# Altium project a4403-ELE-CAD.PrjPcb (part 2 of 4)

## Sheet Hdr3.SchDoc
size Letter; SheetNumber: 10; SheetTotal: 15
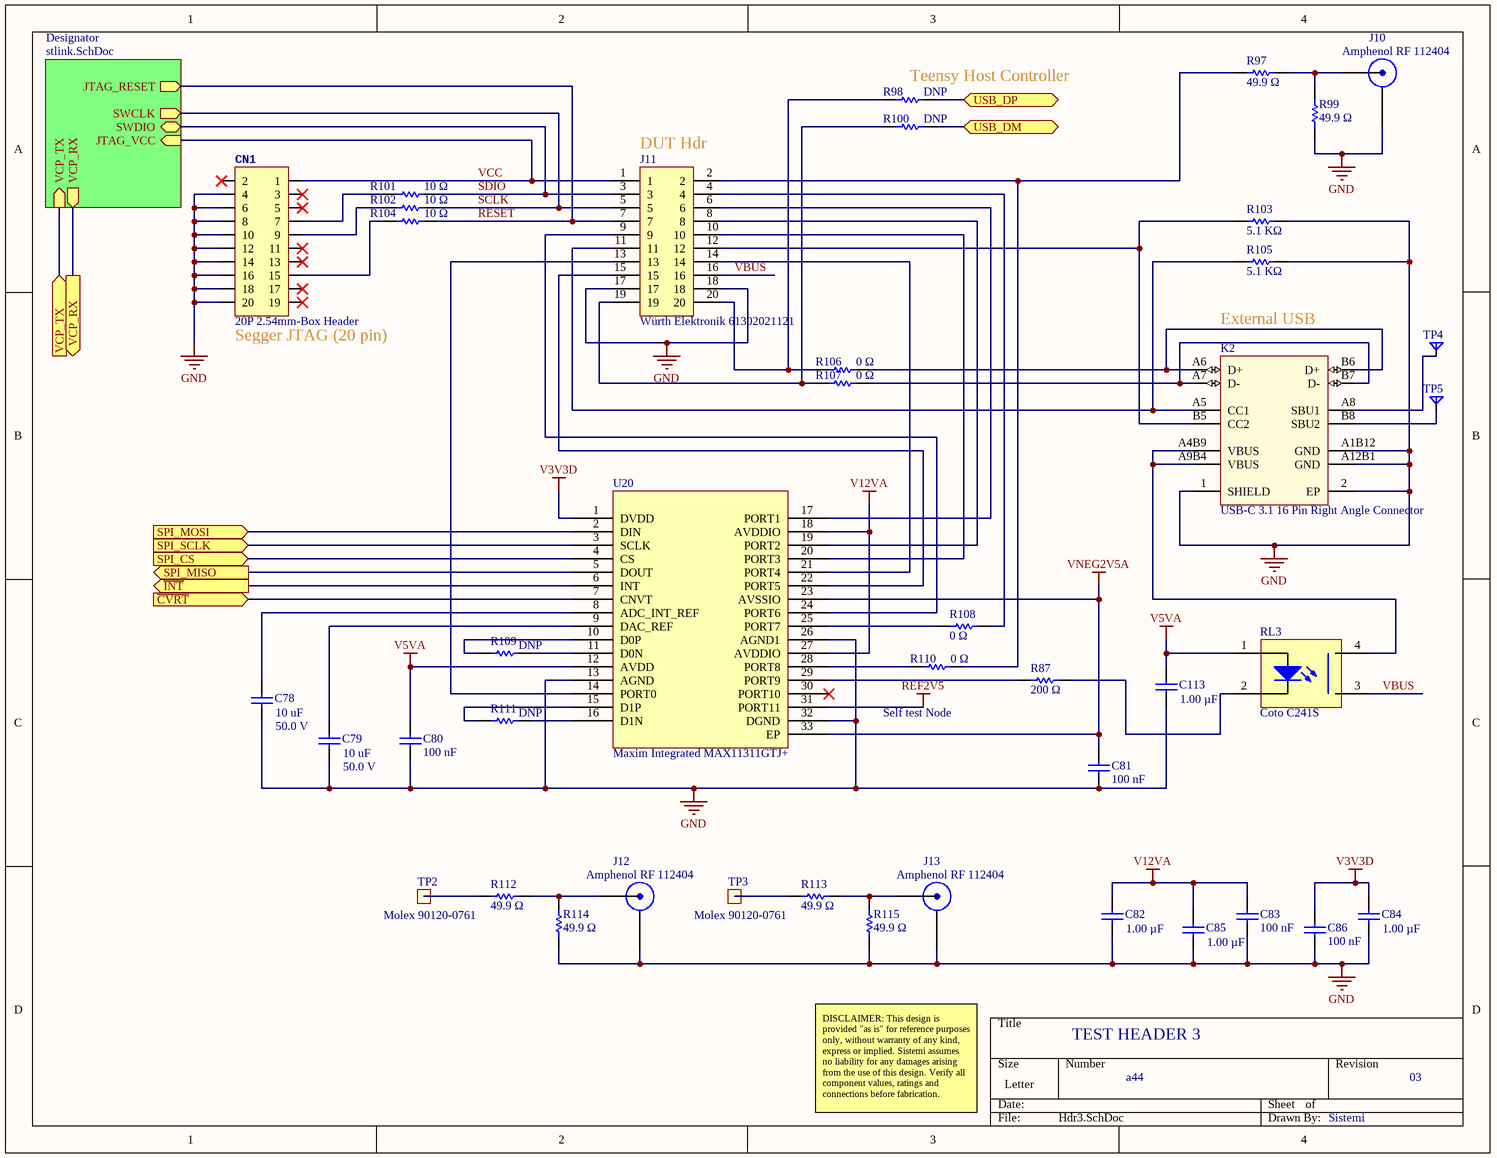
[diagram p5: Hdr3.SchDoc]

### Parts
C78  Capacitance: 10 uF  Voltage Rating (DC): 50.0 V  [CAPC3216X180X55LL20T25]  (hidden comment: Murata GRM31CR61H106KA12L)
C79  Capacitance: 10 uF  Voltage Rating (DC): 50.0 V  [CAPC3216X180X55LL20T25]  (hidden comment: Murata GRM31CR61H106KA12L)
C80  Capacitance: 100 nF  [CAPC1005X56X25NL10T15]  (hidden comment: Samsung CL05B104KO5NNNC)
C81  Capacitance: 100 nF  [CAPC1005X56X25NL10T15]  (hidden comment: Samsung CL05B104KO5NNNC)
C82  Capacitance: 1.00 µF  [CAPC1608X90X35NL15T15]  (hidden comment: Samsung CL10B105KA8NNNC)
C83  Capacitance: 100 nF  [CAPC1005X56X25NL10T15]  (hidden comment: Samsung CL05B104KO5NNNC)
C84  Capacitance: 1.00 µF  [CAPC1608X90X35NL15T15]  (hidden comment: Samsung CL10B105KA8NNNC)
C85  Capacitance: 1.00 µF  [CAPC1608X90X35NL15T15]  (hidden comment: Samsung CL10B105KA8NNNC)
C86  Capacitance: 100 nF  [CAPC1005X56X25NL10T15]  (hidden comment: Samsung CL05B104KO5NNNC)
C113  Capacitance: 1.00 µF  [CAPC1608X90X35NL15T15]  (hidden comment: Samsung CL10B105KA8NNNC)
CN1  20P 2.54mm-Box Header  [PCB-h3ow9p0wpqltbs651onh-1]
J10  Amphenol RF 112404  [PCB-bfdufqe5asedaz2dexug-1]
J11  Würth Elektronik 61302021121  [PCB-nk6cd1c3p7lqby8wsdwb-1]
J12  Amphenol RF 112404  [PCB-bfdufqe5asedaz2dexug-1]
J13  Amphenol RF 112404  [PCB-bfdufqe5asedaz2dexug-1]
K2  USB-C 3.1 16 Pin Right Angle Connector  [PCB-ld6ppm2v3fcnldhcn63r-1]
R87  Resistance: 200 Ω  [RESC1608X55X30LL15T15]  (hidden comment: Generic RES 0603)
R97  Resistance: 49.9 Ω  [RESC1608X55X30ML15T15]  (hidden comment: Generic RES 0603)
R98  Resistance: DNP  [RESC1608X55X30ML15T15]  (hidden comment: Generic RES 0603)
R99  Resistance: 49.9 Ω  [RESC1608X55X30ML15T15]  (hidden comment: Generic RES 0603)
R100  Resistance: DNP  [RESC1608X55X30ML15T15]  (hidden comment: Generic RES 0603)
R101  Resistance: 10 Ω  [RESC1005X40X25NL05T05]  (hidden comment: 10 Ω,±1%,0402)
R102  Resistance: 10 Ω  [RESC1005X40X25NL05T05]  (hidden comment: 10 Ω,±1%,0402)
R103  Resistance: 5.1 KΩ  [RESC1608X55X30ML15T15]  (hidden comment: Generic RES 0603)
R104  Resistance: 10 Ω  [RESC1005X40X25NL05T05]  (hidden comment: 10 Ω,±1%,0402)
R105  Resistance: 5.1 KΩ  [RESC1608X55X30ML15T15]  (hidden comment: Generic RES 0603)
R106  Resistance: 0 Ω  [RESC1608X55X30ML15T15]  (hidden comment: Generic RES 0603)
R107  Resistance: 0 Ω  [RESC1608X55X30ML15T15]  (hidden comment: Generic RES 0603)
R108  Resistance: 0 Ω  [RESC1608X55X30ML15T15]  (hidden comment: Generic RES 0603)
R109  Resistance: DNP  [RESC1608X55X30ML15T15]  (hidden comment: Generic RES 0603)
R110  Resistance: 0 Ω  [RESC1608X55X30ML15T15]  (hidden comment: Generic RES 0603)
R111  Resistance: DNP  [RESC1608X55X30ML15T15]  (hidden comment: Generic RES 0603)
R112  Resistance: 49.9 Ω  [RESC1608X55X30ML15T15]  (hidden comment: Generic RES 0603)
R113  Resistance: 49.9 Ω  [RESC1608X55X30ML15T15]  (hidden comment: Generic RES 0603)
R114  Resistance: 49.9 Ω  [RESC1608X55X30ML15T15]  (hidden comment: Generic RES 0603)
R115  Resistance: 49.9 Ω  [RESC1608X55X30ML15T15]  (hidden comment: Generic RES 0603)
RL3  Coto C241S  [PCB-o1m8470la7x8r6xoffbd-1]
TP2  Molex 90120-0761  [PCB-u1j2a009byds4mriae4x-1]
TP3  Molex 90120-0761  [PCB-u1j2a009byds4mriae4x-1]
TP4  Test Point Pad  [PCB-w5299rxaittb4m04ntfs-1]  (value not drawn)
TP5  Test Point Pad  [PCB-w5299rxaittb4m04ntfs-1]  (value not drawn)
U20  Maxim Integrated MAX11311GTJ+  [PCB-s1hzzxkmij8s4b201del-1]

### Sub-sheets
Designator = stlink.SchDoc: SWCLK (out), JTAG_RESET (out), SWDIO (bidir), JTAG_VCC (in), VCP_TX (in), VCP_RX (out)

### Ports
SPI_CS (in), SPI_MISO (out), SPI_MOSI (in), SPI_SCLK (in), USB_DM (bidir), USB_DP (bidir), VCP_RX (out), VCP_TX (in), ~{CVRT} (in), ~{INT} (out)

### Nets
GND: C78.1 C79.1 C80.2 C81.2 C82.1 C83.2 C84.1 C85.1 C86.2 C113.1 CN1.4 CN1.6 CN1.8 CN1.10 CN1.12 CN1.14 CN1.16 CN1.18 CN1.20 J10.2 J11.17 J11.18 J12.2 J13.2 K2.1(SHIELD) K2.2(EP) K2.A1B12(GND) K2.A12B1(GND) R99.2 R103.1 R105.1 R114.2 R115.2 U20.13(AGND) U20.26(AGND1) U20.32(DGND)
REF2V5: U20.31(PORT11)
V3V3D: C84.2 C86.1 U20.1(DVDD)
V5VA: C80.1 C113.2 RL3.1(A) U20.12(AVDD)
V12VA: C82.2 C83.1 C85.2 U20.18(AVDDIO) U20.27(AVDDIO)
VNEG2V5A: C81.1 U20.23(AVSSIO) U20.33(EP)
ADC_INT: U20.6(INT) ; port ~{INT}
RESET: J11.7 R104.1 ; sheet Designator/JTAG_RESET
SCLK: J11.5 R102.1 ; sheet Designator/SWCLK
SDIO: J11.3 R101.1 ; sheet Designator/SWDIO
SPI_CS_HDR3: U20.4(CS) ; port SPI_CS
SPI_MISO: U20.5(DOUT) ; port SPI_MISO
SPI_MOSI: U20.2(DIN) ; port SPI_MOSI
SPI_SCK: U20.3(SCLK) ; port SPI_SCLK
VBUS: J11.16 RL3.3(S)
VCC: CN1.1 J11.1 ; sheet Designator/JTAG_VCC
NetC78_2: C78.2 U20.8(ADC_INT_REF)
NetC79_2: C79.2 U20.9(DAC_REF)
NetCN1_7: CN1.7 R101.2
NetCN1_9: CN1.9 R102.2
NetCN1_15: CN1.15 R104.2
NetJ10_1: J10.1 R97.2 R99.1
NetJ11_2: J11.2 R97.1 R110.1
NetJ11_4: J11.4 R108.1
NetJ11_6: J11.6 U20.17(PORT1)
NetJ11_8: J11.8 U20.19(PORT2)
NetJ11_9: J11.9 U20.24(PORT6)
NetJ11_10: J11.10 U20.20(PORT3)
NetJ11_11: J11.11 K2.A5(CC1) R105.2
NetJ11_12: J11.12 K2.B5(CC2) R103.2
NetJ11_13: J11.13 U20.14(PORT0)
NetJ11_14: J11.14 U20.21(PORT4)
NetJ11_15: J11.15 U20.22(PORT5)
NetJ11_19: J11.19 R100.2 R107.2
NetJ11_20: J11.20 R98.2 R106.2
NetJ12_1: J12.1 R112.2 R114.1
NetJ13_1: J13.1 R113.2 R115.1
NetK2_A4B9: K2.A4B9(VBUS) K2.A9B4(VBUS) RL3.4(D)
NetK2_A6: K2.A6(D+) K2.B6(D+) R106.1
NetK2_A7: K2.A7(D-) K2.B7(D-) R107.1
NetK2_A8: K2.A8(SBU1) TP4.1(A)
NetK2_B8: K2.B8(SBU2) TP5.1(A)
NetR87_1: R87.1 RL3.2(K)
NetR87_2: R87.2 U20.29(PORT9)
NetR98_1: R98.1 ; port USB_DP
NetR100_1: R100.1 ; port USB_DM
NetR108_2: R108.2 U20.25(PORT7)
NetR109_1: R109.1 U20.11(D0N)
NetR109_2: R109.2 U20.10(D0P)
NetR110_2: R110.2 U20.28(PORT8)
NetR111_1: R111.1 U20.16(D1N)
NetR111_2: R111.2 U20.15(D1P)
NetR112_1: R112.1 TP2.1
NetR113_1: R113.1 TP3.1
NetR135_1: port VCP_TX, sheet Designator/VCP_TX
NetR136_1: port VCP_RX, sheet Designator/VCP_RX
NetU1_9: U20.7(CNVT) ; port ~{CVRT}

Not connected (* = marked no-connect by the designer): CN1 2* 3* 5* 11* 13* 17* 19*; U20 30(PORT10)*

### Notes on the sheet
- (near R98) Teensy Host Controller
- (near J11) DUT Hdr
- (near CN1) Segger JTAG (20 pin)
- External USB
- (near R110) Self test Node
- TEST HEADER 3
- DISCLAIMER: This design is provided "as is" for reference purposes only, without warranty of any kind, express or implied. Sistemi assumes no liability for any damages arising from the use of this design. Verify all component values, ratings and connections before fabrication.
- a44
- 03
- Sistemi

### Library data of the parts
C78 C79 = CMP-3554908-2: as C24 on sheet VBAT; Dielectric Characteristic: X5R; Lifecycle Status: Active; Mounting Style: Surface Mount; Number of Pins: 2; Octopart Url: https://octopart.com/grm31cr61h106ka12l-murata-18903335; OctopartID: fd8535afa9c42242; Packaging: Cut Tape (CT); REACH SVHC Compliance: No SVHC; RoHS: Compliant; Size-Length: 0.0032 m; Size-Thickness: 0.0016 m; Size-Width: 0.0016 m
C80 C81 C83 C86 = CMP-bf2276a55d9a60e5-19: as C25 on sheet VBAT; Mounting Style: Surface Mount; Case/Package: 0402; OctopartID: 0755ced2c795d892; Footprint: PCB-0002-00476-3; Octopart URL: https://octopart.com/cl05b104ko5nnnc-samsung-9299366; RoHS: Compliant; Manufacturer Part Number: CL05B104KO5NNNC
C82 C84 C85 C113 = CMP-7473528-5: as C26 on sheet VBAT; RoHS: Compliant; Mounting Style: Surface Mount; Footprint: PCB-0002-00062-3; Octopart URL: http://octopart.com/cl10b105ka8nnnc-samsung-19831597; Case/Package: 0603; OctopartID: ce7a065e703111bd; Dielectric Characteristic: X7R
CN1 = CMP-2336eab41549fcf1-2: Male Box Header WR-BHD, THT, Vertical, pitch 2.54 mm, 20 pins; Manufacturer Part Number: 61202021621; Number of Contacts: 20; Dielectric Withstanding Voltage: 500 V; Current Rating: 3.00 A; Pin Pitch: 2.54 mm; Contact Resistance: 20.0 mΩ; Operating Voltage: 250 V; Insulation Resistance: 1.00 GΩ; Flammability Rating: UL 94 V-0; REACH SVHC Compliance: No SVHC; Color: Black; RoHS: Compliant; Mounting Style: Through Hole; Number of Pins: 20; Contact Plating: Gold; Packaging: Tray; OctopartID: 2336eab41549fcf1; Orientation: Vertical; Contact Material: Copper; Operating Temperature: -40.0 °C (min); Octopart URL: https://octopart.com/61202021621-w%C3%BCrth+elektronik-8917785; Gender: Male
J10 J12 J13 = CMP-eda0265619973267-4: connector, rf coaxial, bnc str pcb mt recept jack, 4 legs, length .717 inch, 50 ohm; Manufacturer Part Number: 112404; Lead-Free Status: Lead Free; Gender: Male; Frequency: 4.00 GHz (max); Dielectric Material: Teflon; OctopartID: eda0265619973267; ComponentLink1URL: https://grabcad.com/library/amphenol-rf-4-ghz-bnc-coaxial-bulkhead-vertical-pcb-connector-1; Contact Material: Phosphor Bronze; Mounting Style: Through Hole; Contact Plating: Gold; Octopart URL: https://octopart.com/112404-amphenol+rf-50123089; ComponentLink1Description: STEP model; RoHS: Compliant
J11 = CMP-005cc8a3733edf9b-7: as J5 on sheet Hdr1; Contact Material: Copper; Footprint: PCB-005cc8a3733edf9b-1; Mounting Style: Through Hole; Color: Black; Contact Plating: Gold; REACH SVHC Compliance: No SVHC; RoHS: Compliant; Octopart URL: https://octopart.com/61302021121-w%C3%BCrth+elektronik-32855556; Packaging: Bag; Orientation: Vertical; OctopartID: 005cc8a3733edf9b; Number of Pins: 20; Operating Temperature: -40.0 °C (min); Manufacturer Part Number: 61302021121
K2 = CMP-qyb7yekqcd84h33ugas0-5: Manufacturer Part Number: USB4105-GF-A-120; CustomComponentID: qyb7yekqcd84h33ugas0
R87 = CMP-0800c38b3cf2d7c7-3: as R30 on sheet VBAT; Octopart URL: TBD; Number of Pins: 2; Mounting Style: Surface Mount; Packaging: Tape & Reel (TR); Lifecycle Status: Active; RoHS: Compliant; Case: 0603; Operating Temperature: -55.0 °C to 125 °C; REACH SVHC Compliance: No SVHC; Footprint: PCB-0002-00066-3; OctopartID: a8e96364fc37772e
R97 R99 R112-R115 = CMP-0800c38b3cf2d7c7-3: Generic RES 0603, =Resistance+','+Tolerance+','+Case; Manufacturer Part Number: AC1206FR-0749R9L; Case/Package (SI): 1608; Lead-Free Status: Lead Free; Power Rating: 63.0 mW; Voltage: 50V; ELV Compliant: Compliant; Tolerance: ±1%; Temperature Coefficient: -50.0 ppm/°C to 50.0 ppm/°C; Octopart URL: TBD; Number of Pins: 2; Mounting Style: Surface Mount; Packaging: Tape & Reel (TR); Lifecycle Status: Active; RoHS: Compliant; Case: 0603; Operating Temperature: -55.0 °C to 125 °C; REACH SVHC Compliance: No SVHC; Footprint: PCB-0002-00066-3; OctopartID: a8e96364fc37772e
R98 R100 R109 R111 = CMP-0800c38b3cf2d7c7-3: as R31 on sheet VBAT; Octopart URL: TBD; Number of Pins: 2; Mounting Style: Surface Mount; Packaging: Tape & Reel (TR); Lifecycle Status: Active; RoHS: Compliant; Case: 0603; Operating Temperature: -55.0 °C to 125 °C; REACH SVHC Compliance: No SVHC; Footprint: PCB-0002-00066-3; OctopartID: a8e96364fc37772e
R101 R102 R104 = CMP-3902036-3: as R37 on sheet VBAT; Mounting Style: Surface Mount; RoHS: Compliant; Number of Pins: 2; Tolerance: ±1%; Octopart Url: TBD; Case: 0402; OctopartID: 26dced8948c2f91b
R103 R105 = CMP-0800c38b3cf2d7c7-3: as R32 on sheet VBAT; Octopart URL: TBD; Number of Pins: 2; Mounting Style: Surface Mount; Packaging: Tape & Reel (TR); Lifecycle Status: Active; RoHS: Compliant; Case: 0603; Operating Temperature: -55.0 °C to 125 °C; REACH SVHC Compliance: No SVHC; Footprint: PCB-0002-00066-3; OctopartID: a8e96364fc37772e
R106-R108 R110 = CMP-0800c38b3cf2d7c7-3: as R38 on sheet Hdr1; Octopart URL: TBD; Number of Pins: 2; Mounting Style: Surface Mount; Packaging: Tape & Reel (TR); Lifecycle Status: Active; RoHS: Compliant; Case: 0603; Operating Temperature: -55.0 °C to 125 °C; REACH SVHC Compliance: No SVHC; Footprint: PCB-0002-00066-3; OctopartID: a8e96364fc37772e
RL3 = CMP-147564696-2: as RL1 on sheet VBAT; OctopartID: 147564696; Manufacturer Part Number: C241S; Octopart Url: https://octopart.com/c241s-coto-147564696
TP2 TP3 = CMP-b48f7df16db76b48-3: 2.54mm (.100") Pitch C-Grid III Header, Single Row, Vertical, 40 Circuits, Gold (Au) Plating; Gender: Male; Current Rating: 3.00 A; Number of Contacts: 1; Glow Wire Compliant: Non-Compliant; Number of Circuits: 40; Halogen Free Status: Not Reviewed; Manufacturer Part Number: 90120-0761; Lifecycle Status: Not Listed by Manufacturer; Contact Material: Brass; OctopartID: b48f7df16db76b48; Orientation: Vertical; RoHS: Compliant; Mounting Style: Through Hole, Vertical; Number of Rows: 1; Contact Plating: Gold; Octopart URL: http://octopart.com/90120-0761-molex-7666782
TP4 TP5 = CMP-lokszv1vctu4w47553pe-6: Test Point
U20 = CMP-2cd8e1e00624f31f-4: as U11 on sheet Hdr1; Manufacturer Part Number: MAX11311GTJ+; Lifecycle Status: Not Listed by Manufacturer; Octopart URL: http://octopart.com/max11311gtj%2B-maxim+integrated-70389658; RoHS: Compliant; Number of Bits: 12; OctopartID: 2cd8e1e00624f31f; Package: TQFN-32; Resolution: 12-bit

## Sheet stlink.SchDoc
size Letter; SheetNumber: 11; SheetTotal: 15
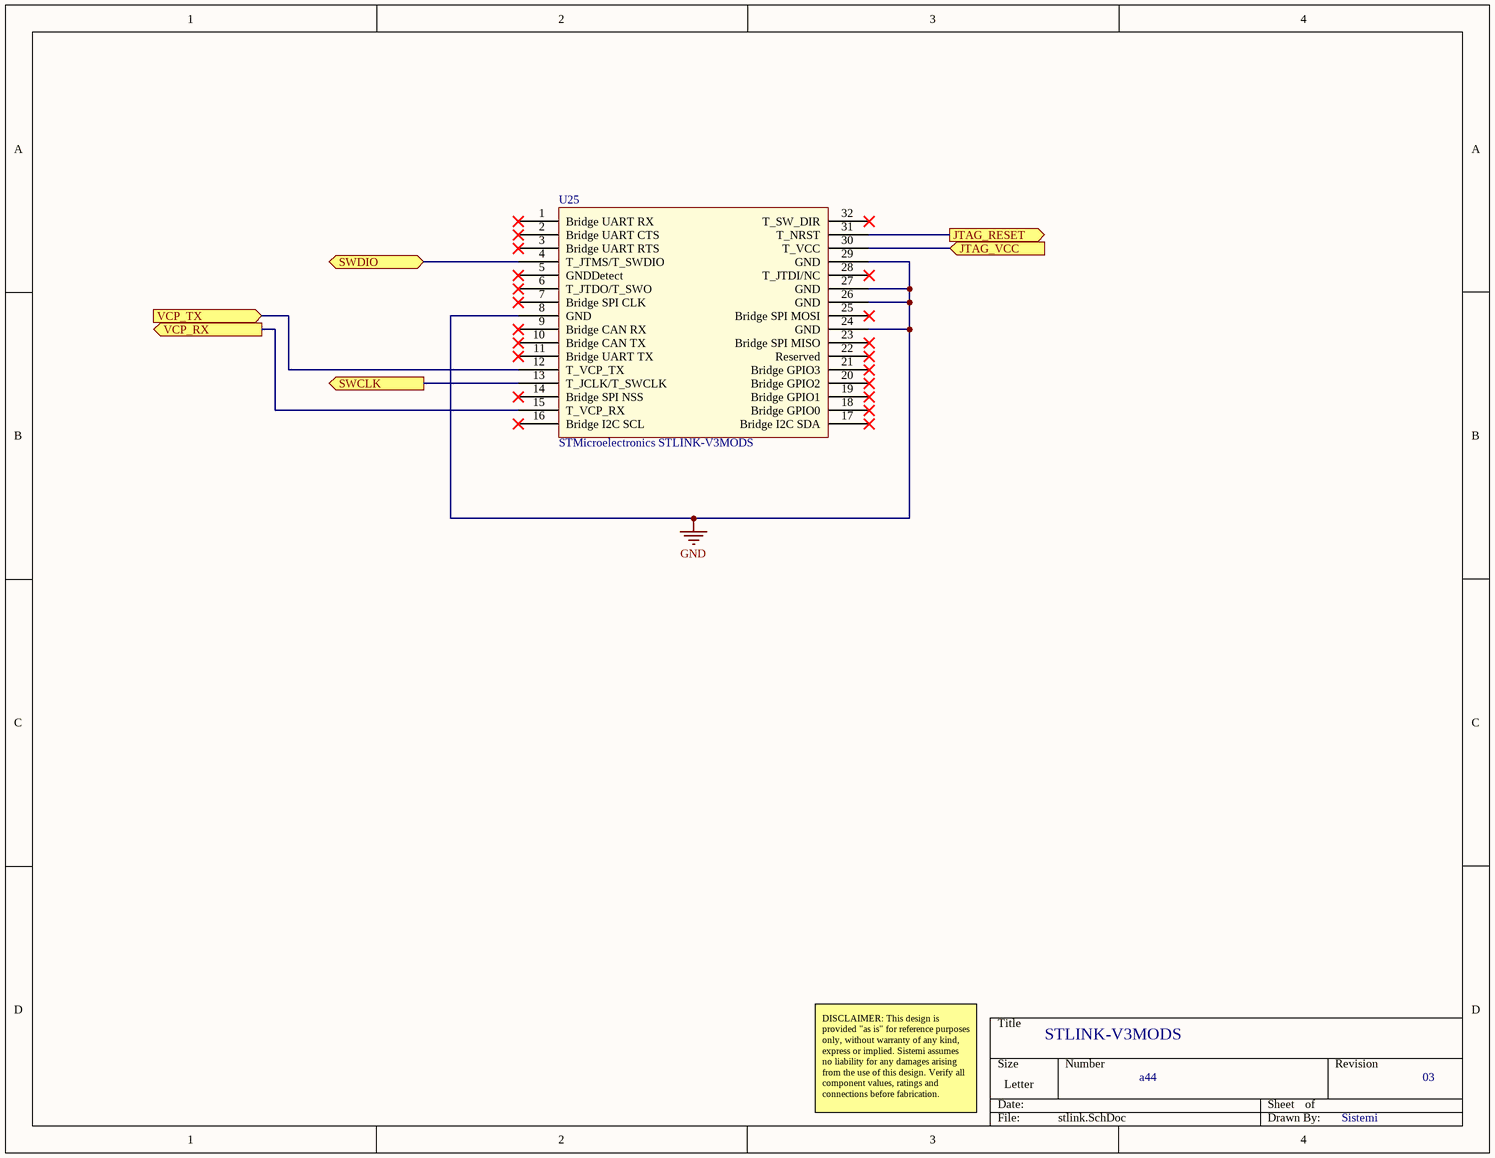
[diagram p6: stlink.SchDoc]

### Parts
U25  STMicroelectronics STLINK-V3MODS  [STMicroelectronics STLINK-V3MODS-Footprint-1]

### Ports
JTAG_RESET (out), JTAG_VCC (in), SWCLK (out), SWDIO (bidir), VCP_RX (out), VCP_TX (in)

### Nets
GND: U25.8(GND) U25.24(GND) U25.26(GND) U25.27(GND) U25.29(GND)
RESET: U25.31(T_NRST) ; port JTAG_RESET
SCLK: U25.13(T_JCLK/T_SWCLK) ; port SWCLK
SDIO: U25.4(T_JTMS/T_SWDIO) ; port SWDIO
VCC: U25.30(T_VCC) ; port JTAG_VCC
NetR135_1: U25.12(T_VCP_TX) ; port VCP_TX
NetR136_1: U25.15(T_VCP_RX) ; port VCP_RX

Not connected (* = marked no-connect by the designer): U25 1(Bridge_UART_RX)* 2(Bridge_UART_CTS)* 3(Bridge_UART_RTS)* 5(GNDDetect)* 6(T_JTDO/T_SWO)* 7(Bridge_SPI_CLK)* 9(Bridge_CAN_RX)* 10(Bridge_CAN_TX)* 11(Bridge_UART_TX)* 14(Bridge_SPI_NSS)* 16(Bridge_I2C_SCL)* 17(Bridge_I2C_SDA)* 18(Bridge_GPIO0)* 19(Bridge_GPIO1)* 20(Bridge_GPIO2)* 21(Bridge_GPIO3)* 22(Reserved)* 23(Bridge_SPI_MISO)* 25(Bridge_SPI_MOSI)* 28(T_JTDI/NC)* 32(T_SW_DIR)*

### Notes on the sheet
- STLINK-V3MODS
- DISCLAIMER: This design is provided "as is" for reference purposes only, without warranty of any kind, express or implied. Sistemi assumes no liability for any damages arising from the use of this design. Verify all component values, ratings and connections before fabrication.
- a44
- 03
- Sistemi

### Library data of the parts
U25 = CMP-cbab04c6b8a5146c-3: STLINK-V3 Modular In-Circuit Debugger and Programmer for STM32 Microcontrollers; Octopart Url: https://octopart.com/stlink-v3mods-stmicroelectronics-107435624; Manufacturer Part Number: STLINK-V3MODS; Lifecycle Status: Not Listed by Manufacturer; OctopartID: cbab04c6b8a5146c

## Sheet Hdr4.SchDoc
size Letter; SheetNumber: 12; SheetTotal: 15
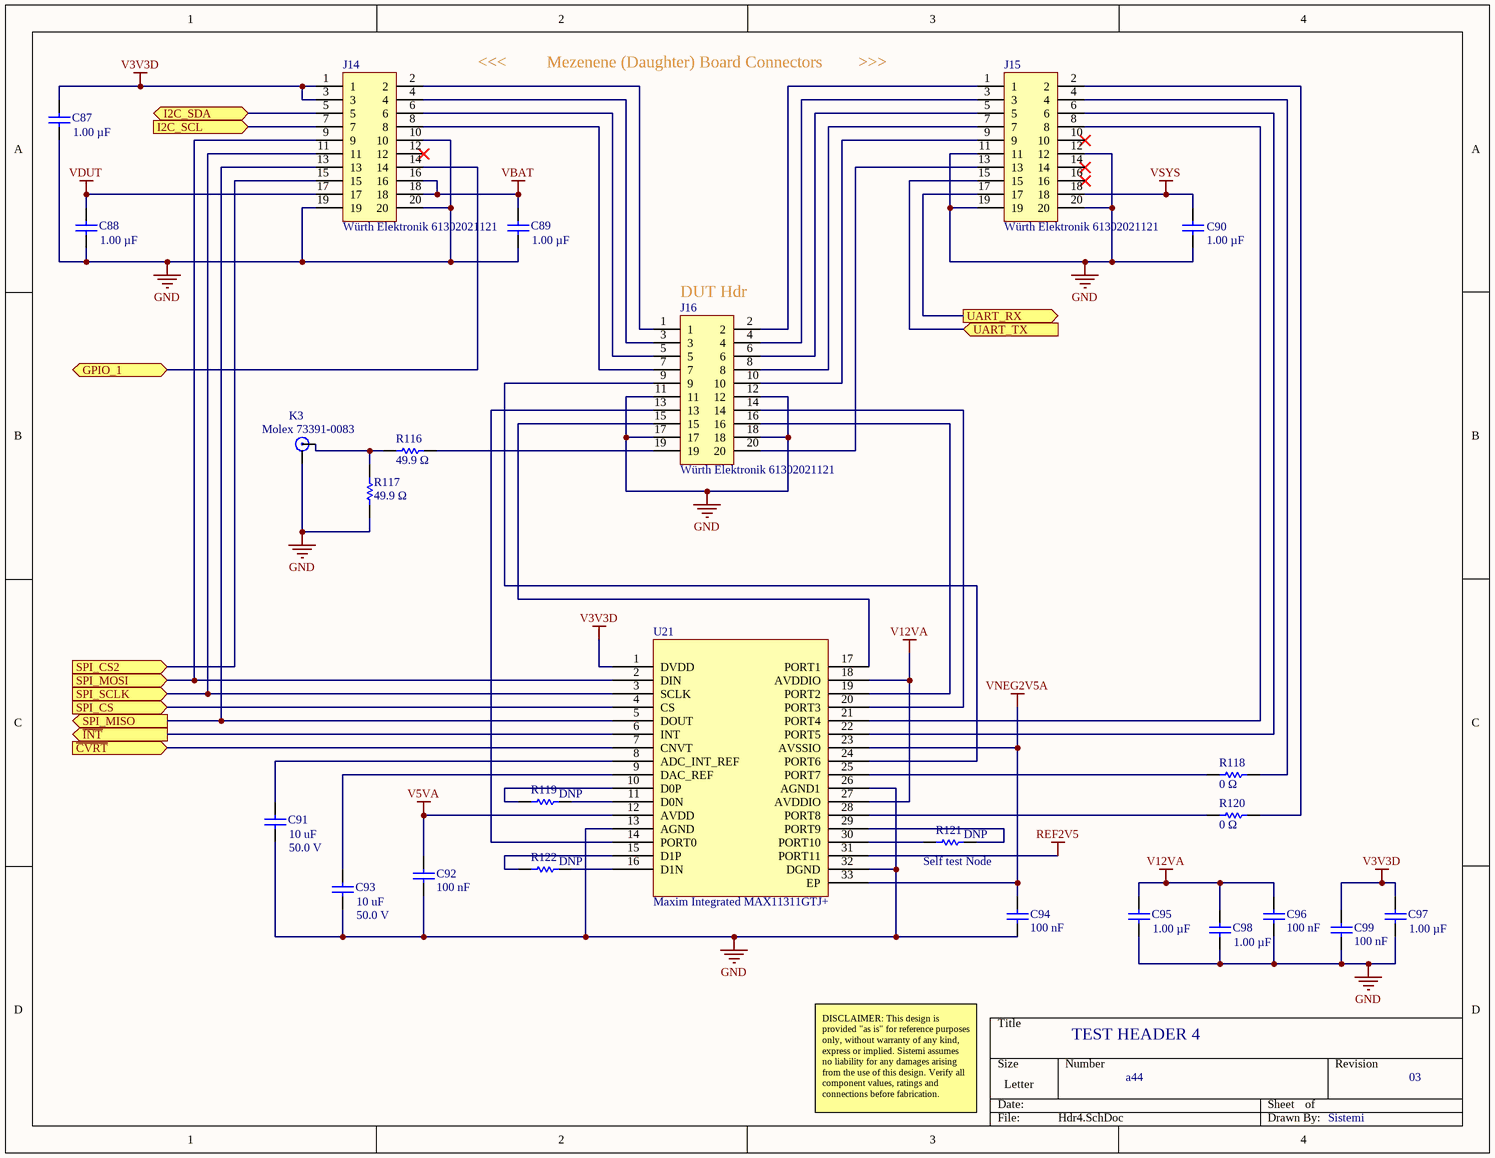
[diagram p7: Hdr4.SchDoc]

### Parts
C87  Capacitance: 1.00 µF  [CAPC1608X90X35NL15T15]  (hidden comment: Samsung CL10B105KA8NNNC)
C88  Capacitance: 1.00 µF  [CAPC1608X90X35NL15T15]  (hidden comment: Samsung CL10B105KA8NNNC)
C89  Capacitance: 1.00 µF  [CAPC1608X90X35NL15T15]  (hidden comment: Samsung CL10B105KA8NNNC)
C90  Capacitance: 1.00 µF  [CAPC1608X90X35NL15T15]  (hidden comment: Samsung CL10B105KA8NNNC)
C91  Capacitance: 10 uF  Voltage Rating (DC): 50.0 V  [CAPC3216X180X55LL20T25]  (hidden comment: Murata GRM31CR61H106KA12L)
C92  Capacitance: 100 nF  [CAPC1005X56X25NL10T15]  (hidden comment: Samsung CL05B104KO5NNNC)
C93  Capacitance: 10 uF  Voltage Rating (DC): 50.0 V  [CAPC3216X180X55LL20T25]  (hidden comment: Murata GRM31CR61H106KA12L)
C94  Capacitance: 100 nF  [CAPC1005X56X25NL10T15]  (hidden comment: Samsung CL05B104KO5NNNC)
C95  Capacitance: 1.00 µF  [CAPC1608X90X35NL15T15]  (hidden comment: Samsung CL10B105KA8NNNC)
C96  Capacitance: 100 nF  [CAPC1005X56X25NL10T15]  (hidden comment: Samsung CL05B104KO5NNNC)
C97  Capacitance: 1.00 µF  [CAPC1608X90X35NL15T15]  (hidden comment: Samsung CL10B105KA8NNNC)
C98  Capacitance: 1.00 µF  [CAPC1608X90X35NL15T15]  (hidden comment: Samsung CL10B105KA8NNNC)
C99  Capacitance: 100 nF  [CAPC1005X56X25NL10T15]  (hidden comment: Samsung CL05B104KO5NNNC)
J14  Würth Elektronik 61302021121  [PCB-nk6cd1c3p7lqby8wsdwb-1]
J15  Würth Elektronik 61302021121  [PCB-nk6cd1c3p7lqby8wsdwb-1]
J16  Würth Elektronik 61302021121  [PCB-nk6cd1c3p7lqby8wsdwb-1]
K3  Molex 73391-0083  [PCB-bfde39zrvmm7lhgxtykn-1]
R116  Resistance: 49.9 Ω  [RESC1608X55X30ML15T15]  (hidden comment: Generic RES 0603)
R117  Resistance: 49.9 Ω  [RESC1608X55X30ML15T15]  (hidden comment: Generic RES 0603)
R118  Resistance: 0 Ω  [RESC1608X55X30ML15T15]  (hidden comment: Generic RES 0603)
R119  Resistance: DNP  [RESC1608X55X30ML15T15]  (hidden comment: Generic RES 0603)
R120  Resistance: 0 Ω  [RESC1608X55X30ML15T15]  (hidden comment: Generic RES 0603)
R121  Resistance: DNP  [RESC1608X55X30ML15T15]  (hidden comment: Generic RES 0603)
R122  Resistance: DNP  [RESC1608X55X30ML15T15]  (hidden comment: Generic RES 0603)
U21  Maxim Integrated MAX11311GTJ+  [PCB-s1hzzxkmij8s4b201del-1]

### Ports
GPIO_1 (bidir), I2C_SCL (in), I2C_SDA (bidir), SPI_CS2 (in), SPI_CS (in), SPI_MISO (out), SPI_MOSI (in), SPI_SCLK (in), UART_RX (out), UART_TX (in), ~{CVRT} (in), ~{INT} (out)

### Nets
GND: C87.1 C88.1 C89.1 C90.1 C91.1 C92.2 C93.1 C94.2 C95.1 C96.2 C97.1 C98.1 C99.2 J14.10 J14.19 J14.20 J15.11 J15.12 J15.19 J15.20 J16.11 J16.12 J16.17 J16.18 K3.2 R117.2 U21.13(AGND) U21.26(AGND1) U21.32(DGND)
REF2V5: U21.31(PORT11)
V3V3D: C87.2 C97.2 C99.1 J14.1 J14.3 U21.1(DVDD)
V5VA: C92.1 U21.12(AVDD)
V12VA: C95.2 C96.1 C98.2 U21.18(AVDDIO) U21.27(AVDDIO)
VBAT: C89.2 J14.16 J14.18
VDUT: C88.2 J14.17
VNEG2V5A: C94.1 U21.23(AVSSIO) U21.33(EP)
VSYS: C90.2 J15.18
ADC_INT: U21.6(INT) ; port ~{INT}
I2C2_SCL: J14.7 ; port I2C_SCL
I2C2_SDA: J14.5 ; port I2C_SDA
SPI_CS2_HDR4: J14.15 ; port SPI_CS2
SPI_CS_HDR4: U21.4(CS) ; port SPI_CS
SPI_MISO: J14.13 U21.5(DOUT) ; port SPI_MISO
SPI_MOSI: J14.9 U21.2(DIN) ; port SPI_MOSI
SPI_SCK: J14.11 U21.3(SCLK) ; port SPI_SCLK
NetC91_2: C91.2 U21.8(ADC_INT_REF)
NetC93_2: C93.2 U21.9(DAC_REF)
NetJ14_2: J14.2 J16.1
NetJ14_4: J14.4 J16.3
NetJ14_6: J14.6 J16.5
NetJ14_8: J14.8 J16.7
NetJ14_14: J14.14 ; port GPIO_1
NetJ15_1: J15.1 J16.2
NetJ15_2: J15.2 R120.1
NetJ15_3: J15.3 J16.4
NetJ15_4: J15.4 R118.1
NetJ15_5: J15.5 J16.6
NetJ15_6: J15.6 U21.22(PORT5)
NetJ15_7: J15.7 J16.8
NetJ15_8: J15.8 U21.21(PORT4)
NetJ15_9: J15.9 J16.10
NetJ15_13: J15.13 J16.20
NetJ15_15: J15.15 ; port UART_TX
NetJ15_17: J15.17 ; port UART_RX
NetJ16_9: J16.9 U21.24(PORT6)
NetJ16_13: J16.13 U21.14(PORT0)
NetJ16_14: J16.14 U21.20(PORT3)
NetJ16_15: J16.15 U21.17(PORT1)
NetJ16_16: J16.16 U21.19(PORT2)
NetJ16_19: J16.19 R116.2
NetK3_1: K3.1 R116.1 R117.1
NetR118_2: R118.2 U21.25(PORT7)
NetR119_1: R119.1 U21.11(D0N)
NetR119_2: R119.2 U21.10(D0P)
NetR120_2: R120.2 U21.28(PORT8)
NetR121_1: R121.1 U21.29(PORT9)
NetR121_2: R121.2 U21.30(PORT10)
NetR122_1: R122.1 U21.16(D1N)
NetR122_2: R122.2 U21.15(D1P)
NetU1_9: U21.7(CNVT) ; port ~{CVRT}

Not connected (* = marked no-connect by the designer): J14 12*; J15 10* 14* 16*

### Notes on the sheet
- (near J15) <<<         Mezenene (Daughter) Board Connectors        >>>
- (near J16) DUT Hdr
- (near R121) Self test Node
- TEST HEADER 4
- DISCLAIMER: This design is provided "as is" for reference purposes only, without warranty of any kind, express or implied. Sistemi assumes no liability for any damages arising from the use of this design. Verify all component values, ratings and connections before fabrication.
- a44
- 03
- Sistemi

### Library data of the parts
C87-C90 C95 C97 C98 = CMP-7473528-5: as C26 on sheet VBAT; RoHS: Compliant; Mounting Style: Surface Mount; Footprint: PCB-0002-00062-3; Octopart URL: http://octopart.com/cl10b105ka8nnnc-samsung-19831597; Case/Package: 0603; OctopartID: ce7a065e703111bd; Dielectric Characteristic: X7R
C91 C93 = CMP-3554908-2: as C24 on sheet VBAT; Dielectric Characteristic: X5R; Lifecycle Status: Active; Mounting Style: Surface Mount; Number of Pins: 2; Octopart Url: https://octopart.com/grm31cr61h106ka12l-murata-18903335; OctopartID: fd8535afa9c42242; Packaging: Cut Tape (CT); REACH SVHC Compliance: No SVHC; RoHS: Compliant; Size-Length: 0.0032 m; Size-Thickness: 0.0016 m; Size-Width: 0.0016 m
C92 C94 C96 C99 = CMP-bf2276a55d9a60e5-19: as C25 on sheet VBAT; Mounting Style: Surface Mount; Case/Package: 0402; OctopartID: 0755ced2c795d892; Footprint: PCB-0002-00476-3; Octopart URL: https://octopart.com/cl05b104ko5nnnc-samsung-9299366; RoHS: Compliant; Manufacturer Part Number: CL05B104KO5NNNC
J14-J16 = CMP-005cc8a3733edf9b-7: as J5 on sheet Hdr1; Contact Material: Copper; Footprint: PCB-005cc8a3733edf9b-1; Mounting Style: Through Hole; Color: Black; Contact Plating: Gold; REACH SVHC Compliance: No SVHC; RoHS: Compliant; Octopart URL: https://octopart.com/61302021121-w%C3%BCrth+elektronik-32855556; Packaging: Bag; Orientation: Vertical; OctopartID: 005cc8a3733edf9b; Number of Pins: 20; Operating Temperature: -40.0 °C (min); Manufacturer Part Number: 61302021121
K3 = CMP-0644cd817e78d983-1: RF Connectors / Coaxial Connectors SMA ST JCK-REC 4HF CUP; Gender: Female; Contact Plating: Gold; Octopart URL: https://octopart.com/73391-0083-molex-47144282; Orientation: Right Angle; OctopartID: 0644cd817e78d983; RoHS: Compliant; Contact Material: Beryllium Copper; Manufacturer Part Number: 73391-0083; Mounting Style: Solder, PCB; Lifecycle Status: Not Listed by Manufacturer
R116 R117 = CMP-0800c38b3cf2d7c7-3: as R97 on sheet Hdr3; Octopart URL: TBD; Number of Pins: 2; Mounting Style: Surface Mount; Packaging: Tape & Reel (TR); Lifecycle Status: Active; RoHS: Compliant; Case: 0603; Operating Temperature: -55.0 °C to 125 °C; REACH SVHC Compliance: No SVHC; Footprint: PCB-0002-00066-3; OctopartID: a8e96364fc37772e
R118 R120 = CMP-0800c38b3cf2d7c7-3: as R38 on sheet Hdr1; Octopart URL: TBD; Number of Pins: 2; Mounting Style: Surface Mount; Packaging: Tape & Reel (TR); Lifecycle Status: Active; RoHS: Compliant; Case: 0603; Operating Temperature: -55.0 °C to 125 °C; REACH SVHC Compliance: No SVHC; Footprint: PCB-0002-00066-3; OctopartID: a8e96364fc37772e
R119 R121 R122 = CMP-0800c38b3cf2d7c7-3: as R31 on sheet VBAT; Octopart URL: TBD; Number of Pins: 2; Mounting Style: Surface Mount; Packaging: Tape & Reel (TR); Lifecycle Status: Active; RoHS: Compliant; Case: 0603; Operating Temperature: -55.0 °C to 125 °C; REACH SVHC Compliance: No SVHC; Footprint: PCB-0002-00066-3; OctopartID: a8e96364fc37772e
U21 = CMP-2cd8e1e00624f31f-4: as U11 on sheet Hdr1; Manufacturer Part Number: MAX11311GTJ+; Lifecycle Status: Not Listed by Manufacturer; Octopart URL: http://octopart.com/max11311gtj%2B-maxim+integrated-70389658; RoHS: Compliant; Number of Bits: 12; OctopartID: 2cd8e1e00624f31f; Package: TQFN-32; Resolution: 12-bit